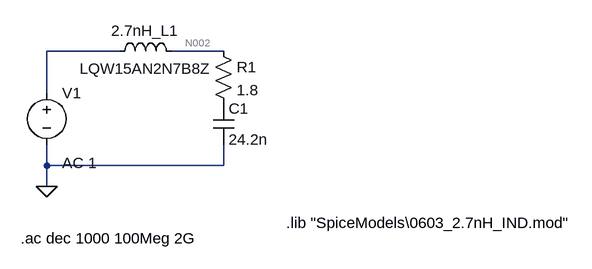
[diagram p0: schematic 2N7H_inductor_parasitics.asc]
2N7H_inductor_parasitics.asc, the LTspice schematic file:
Version 4.1
SHEET 1 916 680
WIRE 176 48 64 48
WIRE 336 48 256 48
WIRE 64 112 64 48
WIRE 64 224 64 192
WIRE 336 224 336 192
WIRE 336 224 64 224
WIRE 64 256 64 224
FLAG 64 256 0
SYMBOL voltage 64 96 R0
WINDOW 123 24 124 Left 2
WINDOW 39 0 0 Left 0
SYMATTR Value2 AC 1
SYMATTR InstName V1
SYMATTR Value ""
SYMBOL ind 160 64 R270
WINDOW 0 32 56 VTop 2
WINDOW 3 5 56 VBottom 2
SYMATTR InstName 2.7nH_L1
SYMATTR Value LQW15AN2N7B8Z
SYMATTR Prefix X
SYMBOL res 320 32 R0
SYMATTR InstName R1
SYMATTR Value 1.8
SYMBOL cap 320 128 R0
SYMATTR InstName C1
SYMATTR Value 24.2n
TEXT 432 312 Left 2 !.lib "SpiceModels\\0603_2.7nH_IND.mod"
TEXT 24 336 Left 2 !.ac dec 1000 100Meg 2G

The netlist it stands for:
* 2N7H_inductor_parasitics.asc
V1 N001 0 AC 1
X§2.7nH_L1 N001 N002 LQW15AN2N7B8Z  ; pins A B
R1 N002 P001 1.8
C1 P001 0 24.2n
.lib "SpiceModels\0603_2.7nH_IND.mod"
.ac dec 1000 100Meg 2G
.backanno
.end

* Results of the author's LTspice run, read from the files saved beside the schematic
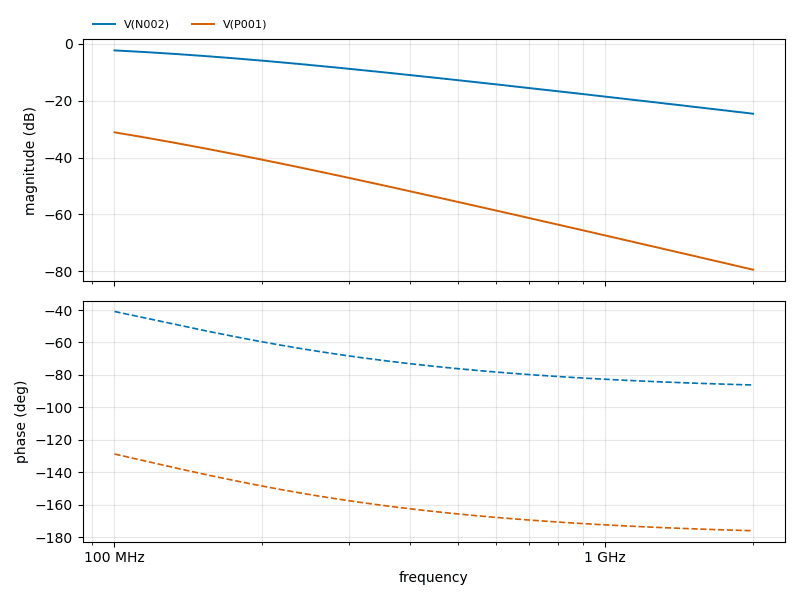
[diagram p1: AC Analysis of 2N7H_inductor_parasitics.asc, plotted from the saved traces]
* AC Analysis, 1 run:
*   V(N002): -2.39 dB at 100 MHz, -24.61 dB at 2 GHz, peak -2.39 dB at 100 MHz, 3 dB below the peak at 182.3 MHz
*   V(P001): -31.14 dB at 100 MHz, -79.38 dB at 2 GHz, peak -31.14 dB at 100 MHz, 3 dB below the peak at 126.2 MHz